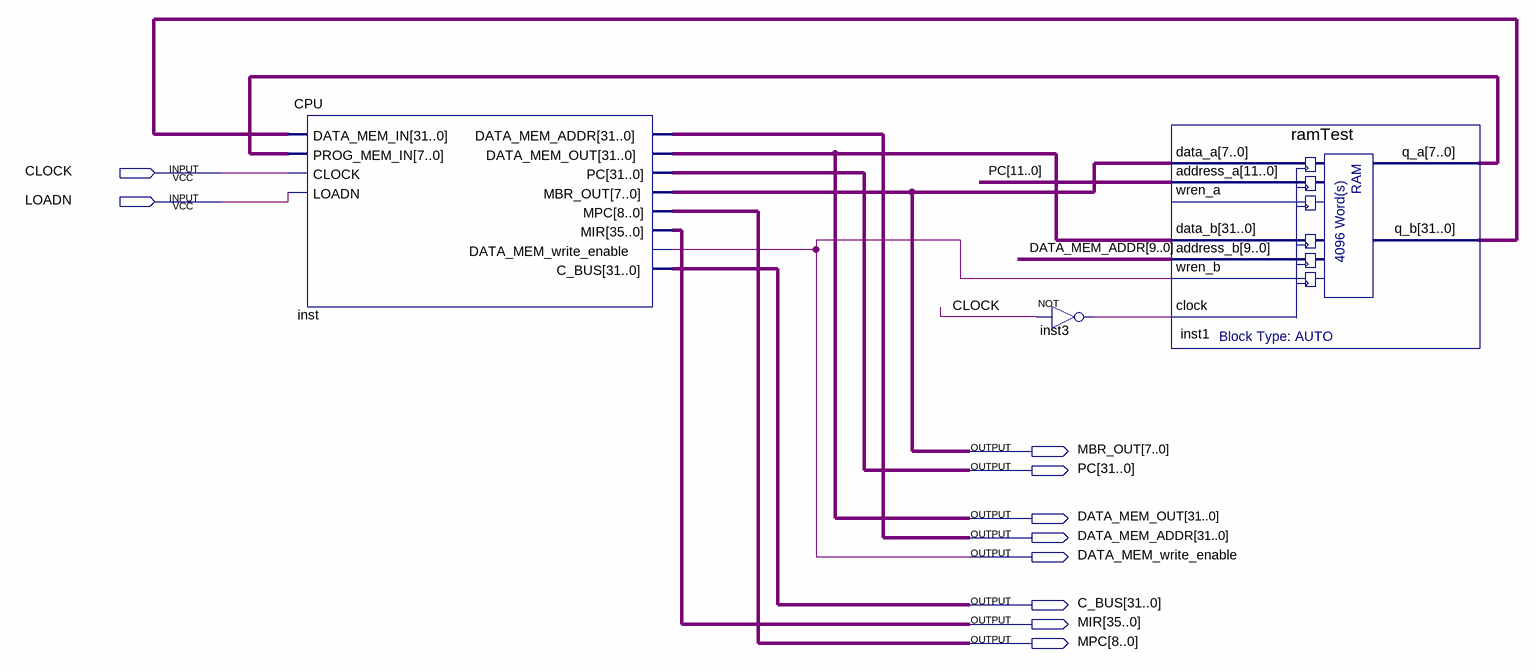
[diagram p0: schematic sheet]
// Quartus schematic CPUeRAM.bdf as structural Verilog: 3 symbols, 10 pins
module CPUeRAM (
  input  CLOCK,
  input  LOADN,
  output [7:0] MBR_OUT,
  output [31:0] PC,
  output [31:0] DATA_MEM_OUT,
  output [31:0] DATA_MEM_ADDR,
  output DATA_MEM_write_enable,
  output [31:0] C_BUS,
  output [35:0] MIR,
  output [8:0] MPC
);

  wire inst3_out;
  wire [7:0] inst1_q_a;
  wire [31:0] inst1_q_b;

  CPU inst (
    .DATA_MEM_IN(inst1_q_b), .PROG_MEM_IN(inst1_q_a), .CLOCK(CLOCK), .LOADN(LOADN),
    .DATA_MEM_ADDR(DATA_MEM_ADDR), .DATA_MEM_OUT(DATA_MEM_OUT), .PC(PC), .MBR_OUT(MBR_OUT), .MPC(MPC),
    .MIR(MIR), .DATA_MEM_write_enable(DATA_MEM_write_enable), .C_BUS(C_BUS));
  not inst3 (inst3_out, CLOCK);
  ramTest inst1 (
    .data_a(MBR_OUT), .address_a(PC[11:0]), .data_b(DATA_MEM_OUT), .address_b(DATA_MEM_ADDR[9:0]),
    .wren_b(DATA_MEM_write_enable), .clock(inst3_out), .q_a(inst1_q_a), .q_b(inst1_q_b));  // open: wren_a
endmodule
